# Altium schematic sheet IBM_PC_CPU.SchDoc
size A3; SheetNumber: 6; SheetTotal: 18
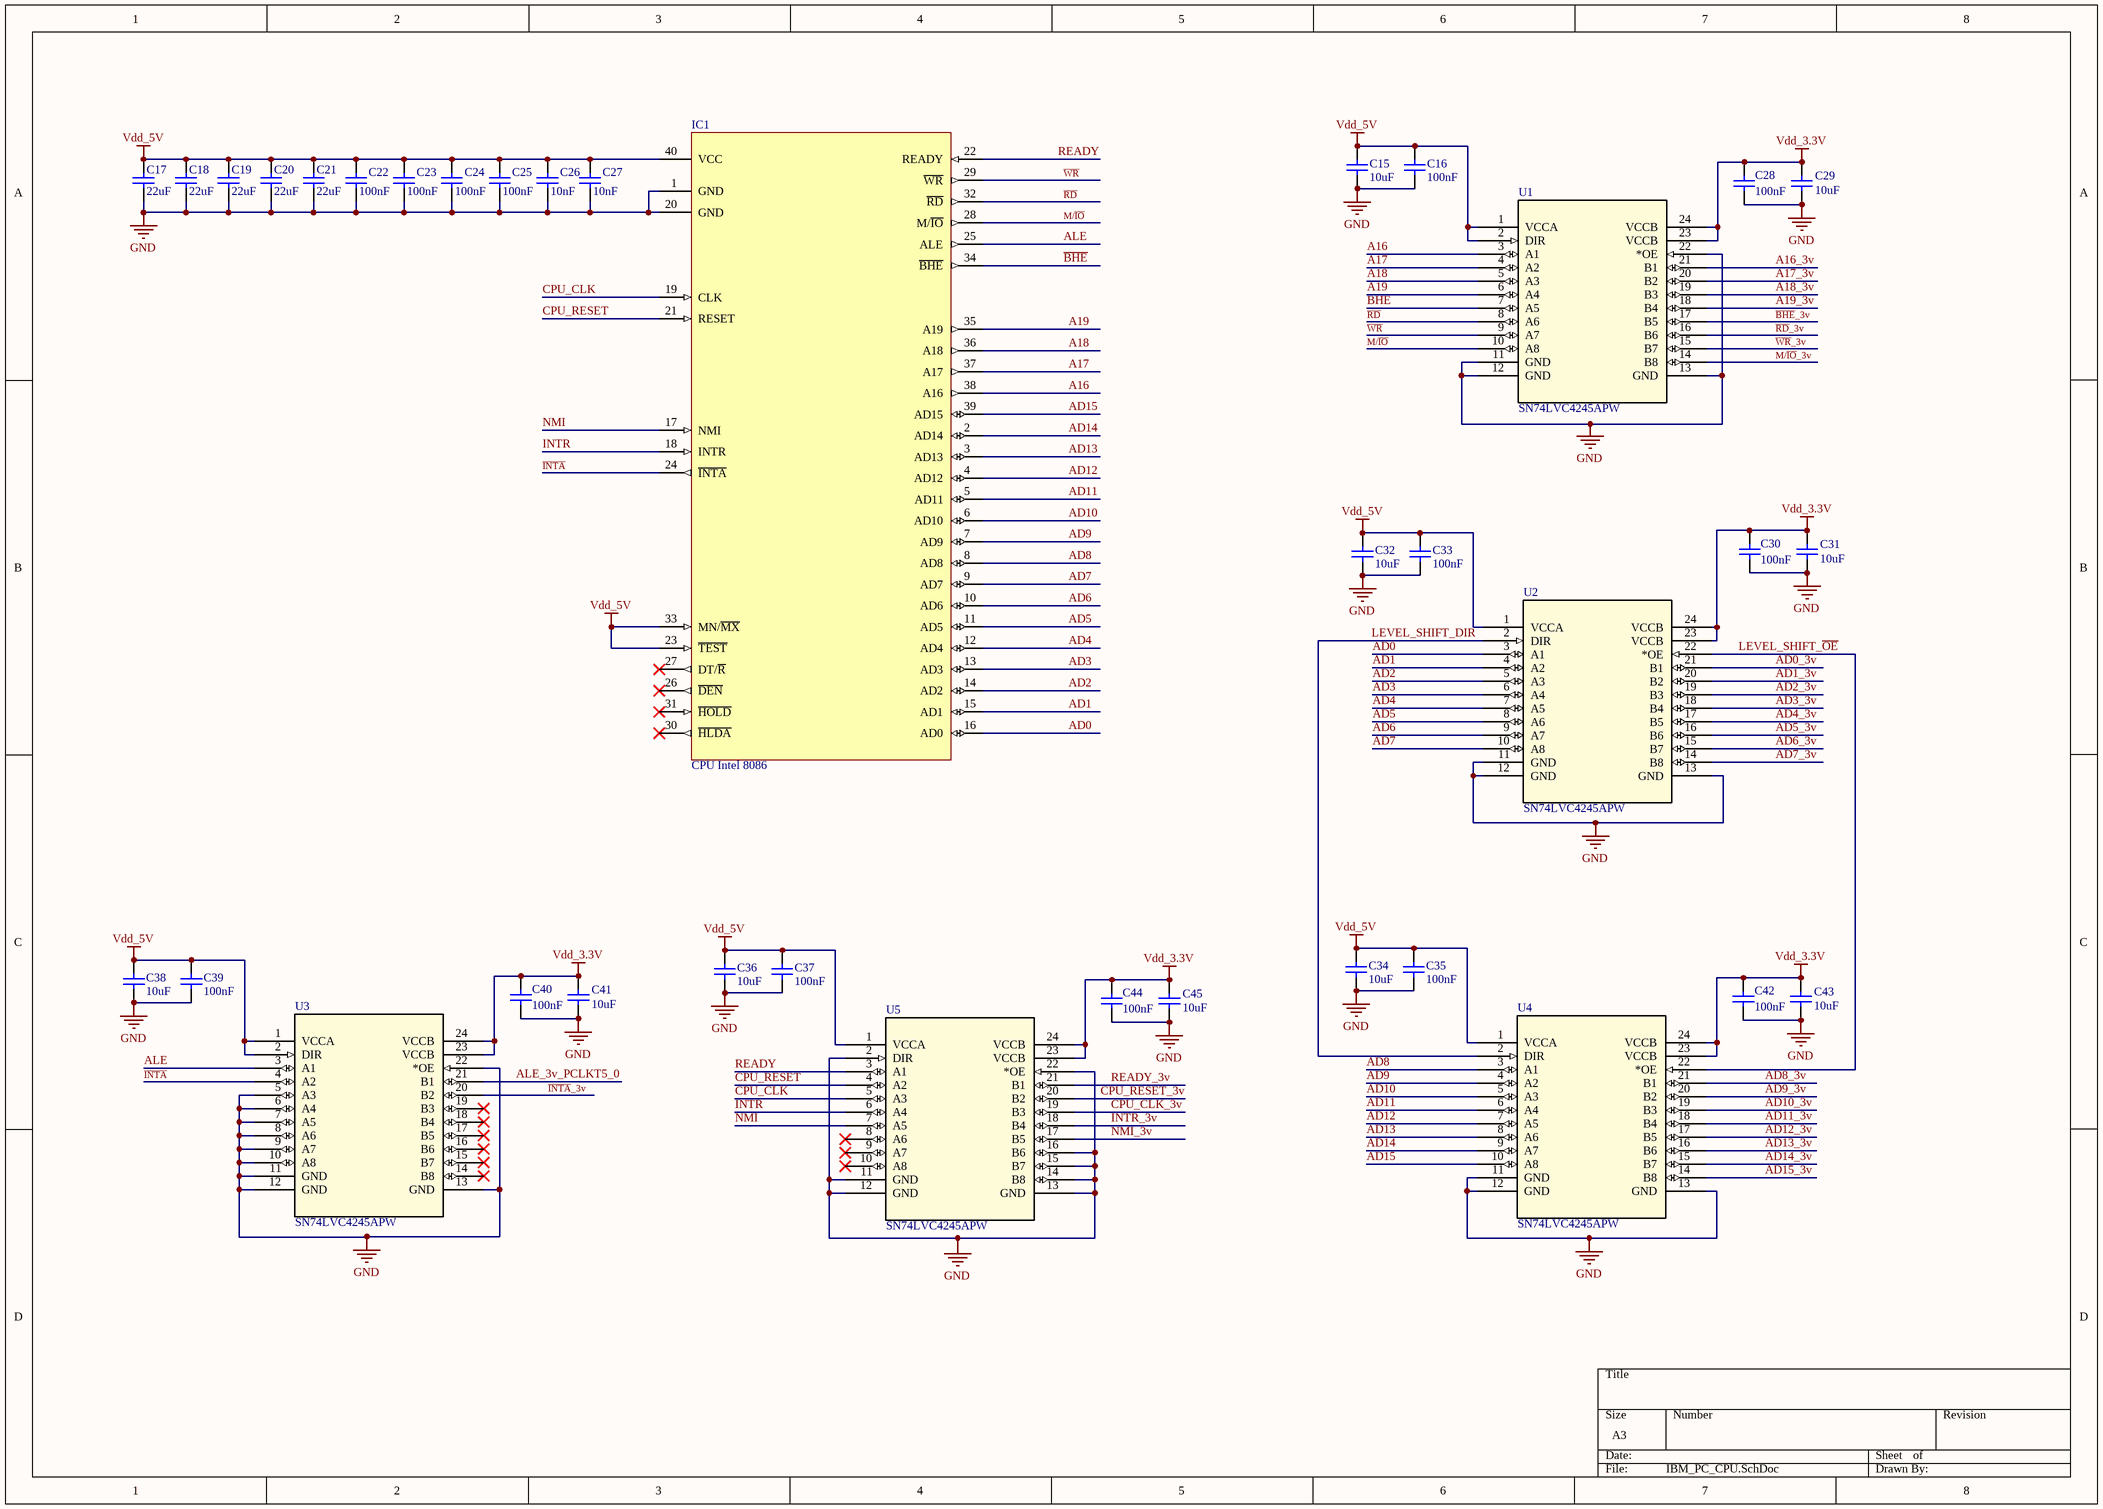
[diagram p0: IBM_PC_CPU.SchDoc]

## Parts
C15  value 10uF  [capacitor 0603]  (hidden comment: ceramic capacitor)
C16  value 100nF  [capacitor 0603]  (hidden comment: Ceramic capacitor)
C17  value 22uF  [capacitor 0805]  (hidden comment: ceramic capacitor)
C18  value 22uF  [capacitor 0805]  (hidden comment: ceramic capacitor)
C19  value 22uF  [capacitor 0805]  (hidden comment: ceramic capacitor)
C20  value 22uF  [capacitor 0805]  (hidden comment: ceramic capacitor)
C21  value 22uF  [capacitor 0805]  (hidden comment: ceramic capacitor)
C22  value 100nF  [capacitor 0805]  (hidden comment: ceramic capacitor)
C23  value 100nF  [capacitor 0805]  (hidden comment: ceramic capacitor)
C24  value 100nF  [capacitor 0805]  (hidden comment: ceramic capacitor)
C25  value 100nF  [capacitor 0805]  (hidden comment: ceramic capacitor)
C26  value 10nF  [capacitor 0805]  (hidden comment: ceramic capacitor)
C27  value 10nF  [capacitor 0805]  (hidden comment: ceramic capacitor)
C28  value 100nF  [capacitor 0603]  (hidden comment: Ceramic capacitor)
C29  value 10uF  [capacitor 0603]  (hidden comment: ceramic capacitor)
C30  value 100nF  [capacitor 0603]  (hidden comment: Ceramic capacitor)
C31  value 10uF  [capacitor 0603]  (hidden comment: ceramic capacitor)
C32  value 10uF  [capacitor 0603]  (hidden comment: ceramic capacitor)
C33  value 100nF  [capacitor 0603]  (hidden comment: Ceramic capacitor)
C34  value 10uF  [capacitor 0603]  (hidden comment: ceramic capacitor)
C35  value 100nF  [capacitor 0603]  (hidden comment: Ceramic capacitor)
C36  value 10uF  [capacitor 0603]  (hidden comment: ceramic capacitor)
C37  value 100nF  [capacitor 0603]  (hidden comment: Ceramic capacitor)
C38  value 10uF  [capacitor 0603]  (hidden comment: ceramic capacitor)
C39  value 100nF  [capacitor 0603]  (hidden comment: Ceramic capacitor)
C40  value 100nF  [capacitor 0603]  (hidden comment: Ceramic capacitor)
C41  value 10uF  [capacitor 0603]  (hidden comment: ceramic capacitor)
C42  value 100nF  [capacitor 0603]  (hidden comment: Ceramic capacitor)
C43  value 10uF  [capacitor 0603]  (hidden comment: ceramic capacitor)
C44  value 100nF  [capacitor 0603]  (hidden comment: Ceramic capacitor)
C45  value 10uF  [capacitor 0603]  (hidden comment: ceramic capacitor)
IC1  CPU Intel 8086  [PDIP-40PIN]
U1  SN74LVC4245APW  [PW24]
U2  SN74LVC4245APW  [PW24]
U3  SN74LVC4245APW  [PW24]
U4  SN74LVC4245APW  [PW24]
U5  SN74LVC4245APW  [PW24]

## Nets
GND: C15.1 C16.1 C17.1 C18.1 C19.1 C20.1 C21.1 C22.2 C23.2 C24.2 C25.2 C26.2 C27.2 C28.1 C29.1 C30.1 C31.1 C32.1 C33.1 C34.1 C35.1 C36.1 C37.1 C38.1 C39.1 C40.1 C41.1 C42.1 C43.1 C44.1 C45.1 IC1.1(GND) IC1.20(GND) U1.11(GND) U1.12(GND) U1.13(GND) U1.22(*OE) U2.11(GND) U2.12(GND) U2.13(GND) U3.5(A3) U3.6(A4) U3.7(A5) U3.8(A6) U3.9(A7) U3.10(A8) U3.11(GND) U3.12(GND) U3.13(GND) U3.22(*OE) U4.11(GND) U4.12(GND) U4.13(GND) U5.2(DIR) U5.11(GND) U5.12(GND) U5.13(GND) U5.14(B8) U5.15(B7) U5.16(B6) U5.22(*OE)
Vdd_3.3V: C28.2 C29.2 C30.2 C31.2 C40.2 C41.2 C42.2 C43.2 C44.2 C45.2 U1.23(VCCB) U1.24(VCCB) U2.23(VCCB) U2.24(VCCB) U3.23(VCCB) U3.24(VCCB) U4.23(VCCB) U4.24(VCCB) U5.23(VCCB) U5.24(VCCB)
Vdd_5V: C15.2 C16.2 C17.2 C18.2 C19.2 C20.2 C21.2 C22.1 C23.1 C24.1 C25.1 C26.1 C27.1 C32.2 C33.2 C34.2 C35.2 C36.2 C37.2 C38.2 C39.2 IC1.23(~{TEST}) IC1.33(MN/~{MX}) IC1.40(VCC) U1.1(VCCA) U1.2(DIR) U2.1(VCCA) U3.1(VCCA) U3.2(DIR) U4.1(VCCA) U5.1(VCCA)
A16: IC1.38(A16) U1.3(A1)
A16_3v: U1.21(B1)
A17: IC1.37(A17) U1.4(A2)
A17_3v: U1.20(B2)
A18: IC1.36(A18) U1.5(A3)
A18_3v: U1.19(B3)
A19: IC1.35(A19) U1.6(A4)
A19_3v: U1.18(B4)
AD0: IC1.16(AD0) U2.3(A1)
AD0_3v: U2.21(B1)
AD1: IC1.15(AD1) U2.4(A2)
AD1_3v: U2.20(B2)
AD2: IC1.14(AD2) U2.5(A3)
AD2_3v: U2.19(B3)
AD3: IC1.13(AD3) U2.6(A4)
AD3_3v: U2.18(B4)
AD4: IC1.12(AD4) U2.7(A5)
AD4_3v: U2.17(B5)
AD5: IC1.11(AD5) U2.8(A6)
AD5_3v: U2.16(B6)
AD6: IC1.10(AD6) U2.9(A7)
AD6_3v: U2.15(B7)
AD7: IC1.9(AD7) U2.10(A8)
AD7_3v: U2.14(B8)
AD8: IC1.8(AD8) U4.3(A1)
AD8_3v: U4.21(B1)
AD9: IC1.7(AD9) U4.4(A2)
AD9_3v: U4.20(B2)
AD10: IC1.6(AD10) U4.5(A3)
AD10_3v: U4.19(B3)
AD11: IC1.5(AD11) U4.6(A4)
AD11_3v: U4.18(B4)
AD12: IC1.4(AD12) U4.7(A5)
AD12_3v: U4.17(B5)
AD13: IC1.3(AD13) U4.8(A6)
AD13_3v: U4.16(B6)
AD14: IC1.2(AD14) U4.9(A7)
AD14_3v: U4.15(B7)
AD15: IC1.39(AD15) U4.10(A8)
AD15_3v: U4.14(B8)
ALE: IC1.25(ALE) U3.3(A1)
ALE_3v_PCLKT5_0: U3.21(B1)
~{BHE}: IC1.34(~{BHE}) U1.7(A5)
~{BHE}_3v: U1.17(B5)
CPU_CLK: IC1.19(CLK) U5.5(A3)
CPU_CLK_3v: U5.19(B3)
CPU_RESET: IC1.21(RESET) U5.4(A2)
CPU_RESET_3v: U5.20(B2)
~{INTA}: IC1.24(~{INTA}) U3.4(A2)
~{INTA}_3v: U3.20(B2)
INTR: IC1.18(INTR) U5.6(A4)
INTR_3v: U5.18(B4)
LEVEL_SHIFT_DIR: U2.2(DIR) U4.2(DIR)
LEVEL_SHIFT_~{OE}: U2.22(*OE) U4.22(*OE)
M/~{IO}: IC1.28(M/~{IO}) U1.10(A8)
M/~{IO}_3v: U1.14(B8)
NMI: IC1.17(NMI) U5.7(A5)
NMI_3v: U5.17(B5)
~{RD}: IC1.32(~{RD}) U1.8(A6)
~{RD}_3v: U1.16(B6)
READY: IC1.22(READY) U5.3(A1)
READY_3v: U5.21(B1)
~{WR}: IC1.29(~{WR}) U1.9(A7)
~{WR}_3v: U1.15(B7)

Not connected (* = marked no-connect by the designer): IC1 26(~{DEN})* 27(DT/~{R})* 30(~{HLDA})* 31(~{HOLD})*; U3 14(B8)* 15(B7)* 16(B6)* 17(B5)* 18(B4)* 19(B3)*; U5 8(A6)* 9(A7)* 10(A8)*

## Library data of the parts
C15 C29 C31 C32 C34 C36 C38 C41 C43 C45 = ceramic capacitor: Multilayer ceramic capacitor; V: 6.3; LCSC part: C1691; Package: 0603
C16 C28 C30 C33 C35 C37 C39 C40 C42 C44 = Ceramic capacitor: Multilayer ceramic capacitor; V: 50; LCSC part: C14663; Package: 0603
C17-C21 = ceramic capacitor: Multilayer ceramic capacitor; V: 25; LCSC part: C45783; Package: 0805
C22-C27 = ceramic capacitor: Multilayer ceramic capacitor; V: 50; Package: 0805
  C22-C25: LCSC part: C1711
  C26 C27: LCSC part: C1710
U1-U5 = SN74LVC4245APW: Octal Bus Transceiver And 3.3-V To 5-V Shifter With 3-State Outputs 24-TSSOP -40 to 85; Manufacturer_Name: Texas Instruments; Copyright: Copyright (C) 2025 Ultra Librarian. All rights reserved.; Manufacturer_Part_Number: SN74LVC4245APW; RefDes: RefDes; Type: Type